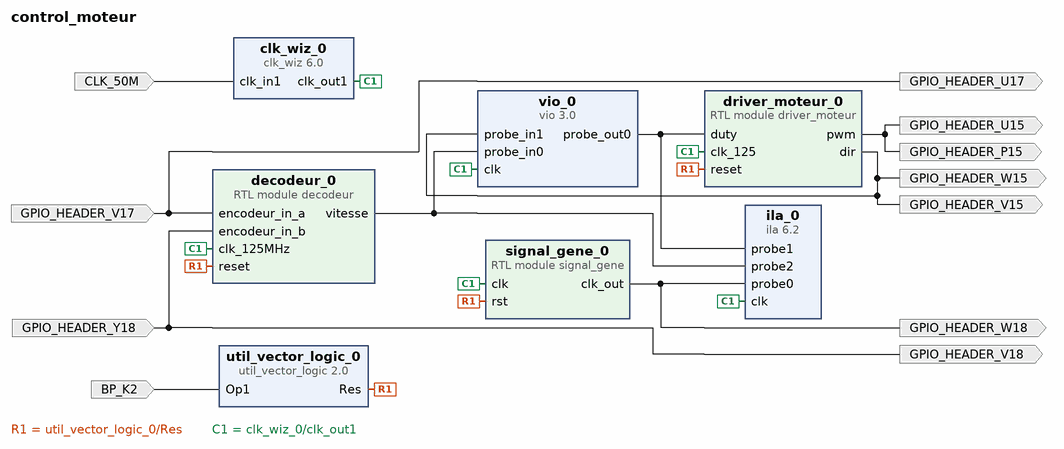
[diagram p0: block diagram of the top level]
# Vivado block design control_moteur, xc7z010clg400-1, Vivado 2020.2
create_bd_design control_moteur

create_bd_port -dir I GPIO_HEADER_V17
create_bd_port -dir I GPIO_HEADER_Y18
create_bd_port -dir I -type rst BP_K2
create_bd_port -dir I -type clk CLK_50M
set_property -dict {CONFIG.FREQ_HZ 50000000} [get_bd_ports CLK_50M]
create_bd_port -dir O GPIO_HEADER_U15
create_bd_port -dir O GPIO_HEADER_V15
create_bd_port -dir O GPIO_HEADER_W15
create_bd_port -dir O GPIO_HEADER_P15
create_bd_port -dir O GPIO_HEADER_V18
create_bd_port -dir O GPIO_HEADER_U17
create_bd_port -dir O GPIO_HEADER_W18

create_bd_cell -type ip -vlnv xilinx.com:ip:clk_wiz:6.0 clk_wiz_0
set_property -dict [list \
  CONFIG.CLKIN1_JITTER_PS 200.0 \
  CONFIG.CLKOUT1_DRIVES BUFG \
  CONFIG.CLKOUT1_JITTER 154.207 \
  CONFIG.CLKOUT1_PHASE_ERROR 164.985 \
  CONFIG.CLKOUT1_REQUESTED_OUT_FREQ 125 \
  CONFIG.CLKOUT2_DRIVES BUFG \
  CONFIG.CLKOUT3_DRIVES BUFG \
  CONFIG.CLKOUT4_DRIVES BUFG \
  CONFIG.CLKOUT5_DRIVES BUFG \
  CONFIG.CLKOUT6_DRIVES BUFG \
  CONFIG.CLKOUT7_DRIVES BUFG \
  CONFIG.MMCM_CLKFBOUT_MULT_F 20.000 \
  CONFIG.MMCM_CLKIN1_PERIOD 20.000 \
  CONFIG.MMCM_CLKIN2_PERIOD 10.0 \
  CONFIG.MMCM_CLKOUT0_DIVIDE_F 8.000 \
  CONFIG.PRIM_IN_FREQ 50.0 \
  CONFIG.SECONDARY_SOURCE Single_ended_clock_capable_pin \
  CONFIG.USE_LOCKED false \
  CONFIG.USE_PHASE_ALIGNMENT false \
  CONFIG.USE_RESET false \
] [get_bd_cells clk_wiz_0]
create_bd_cell -type ip -vlnv xilinx.com:ip:vio:3.0 vio_0
set_property -dict {CONFIG.C_NUM_PROBE_IN 2 CONFIG.C_PROBE_OUT0_WIDTH 16} [get_bd_cells vio_0]
create_bd_cell -type ip -vlnv xilinx.com:ip:util_vector_logic:2.0 util_vector_logic_0
set_property -dict {CONFIG.C_OPERATION not CONFIG.C_SIZE 0} [get_bd_cells util_vector_logic_0]
create_bd_cell -type module -reference driver_moteur driver_moteur_0
create_bd_cell -type module -reference decodeur decodeur_0
create_bd_cell -type ip -vlnv xilinx.com:ip:ila:6.2 ila_0
set_property -dict [list \
  CONFIG.ALL_PROBE_SAME_MU true \
  CONFIG.ALL_PROBE_SAME_MU_CNT 2 \
  CONFIG.C_ADV_TRIGGER true \
  CONFIG.C_DATA_DEPTH 8192 \
  CONFIG.C_ENABLE_ILA_AXI_MON false \
  CONFIG.C_EN_STRG_QUAL 1 \
  CONFIG.C_MONITOR_TYPE Native \
  CONFIG.C_NUM_OF_PROBES 3 \
  CONFIG.C_PROBE0_MU_CNT 2 \
  CONFIG.C_PROBE0_TYPE 0 \
  CONFIG.C_PROBE10_MU_CNT 2 \
  CONFIG.C_PROBE11_MU_CNT 2 \
  CONFIG.C_PROBE12_MU_CNT 2 \
  CONFIG.C_PROBE13_MU_CNT 2 \
  CONFIG.C_PROBE14_MU_CNT 2 \
  CONFIG.C_PROBE15_MU_CNT 2 \
  CONFIG.C_PROBE16_MU_CNT 2 \
  CONFIG.C_PROBE17_MU_CNT 2 \
  CONFIG.C_PROBE18_MU_CNT 2 \
  CONFIG.C_PROBE19_MU_CNT 2 \
  CONFIG.C_PROBE1_MU_CNT 2 \
  CONFIG.C_PROBE1_WIDTH 16 \
  CONFIG.C_PROBE20_MU_CNT 2 \
  CONFIG.C_PROBE21_MU_CNT 2 \
  CONFIG.C_PROBE22_MU_CNT 2 \
  CONFIG.C_PROBE23_MU_CNT 2 \
  CONFIG.C_PROBE24_MU_CNT 2 \
  CONFIG.C_PROBE25_MU_CNT 2 \
  CONFIG.C_PROBE26_MU_CNT 2 \
  CONFIG.C_PROBE27_MU_CNT 2 \
  CONFIG.C_PROBE28_MU_CNT 2 \
  CONFIG.C_PROBE29_MU_CNT 2 \
  CONFIG.C_PROBE2_MU_CNT 2 \
  CONFIG.C_PROBE2_TYPE 0 \
  CONFIG.C_PROBE2_WIDTH 16 \
  CONFIG.C_PROBE30_MU_CNT 2 \
  CONFIG.C_PROBE31_MU_CNT 2 \
  CONFIG.C_PROBE32_MU_CNT 2 \
  CONFIG.C_PROBE33_MU_CNT 2 \
  CONFIG.C_PROBE34_MU_CNT 2 \
  CONFIG.C_PROBE35_MU_CNT 2 \
  CONFIG.C_PROBE36_MU_CNT 2 \
  CONFIG.C_PROBE37_MU_CNT 2 \
  CONFIG.C_PROBE38_MU_CNT 2 \
  CONFIG.C_PROBE39_MU_CNT 2 \
  CONFIG.C_PROBE3_MU_CNT 2 \
  CONFIG.C_PROBE40_MU_CNT 2 \
  CONFIG.C_PROBE41_MU_CNT 2 \
  CONFIG.C_PROBE42_MU_CNT 2 \
  CONFIG.C_PROBE43_MU_CNT 2 \
  CONFIG.C_PROBE4_MU_CNT 2 \
  CONFIG.C_PROBE5_MU_CNT 2 \
  CONFIG.C_PROBE6_MU_CNT 2 \
  CONFIG.C_PROBE7_MU_CNT 2 \
  CONFIG.C_PROBE8_MU_CNT 2 \
  CONFIG.C_PROBE9_MU_CNT 2 \
  CONFIG.C_TRIGIN_EN false \
] [get_bd_cells ila_0]
create_bd_cell -type module -reference signal_gene signal_gene_0
set_property -dict {CONFIG.division_horloge 25000 CONFIG.nb_pulse_etat_haut 12500} [get_bd_cells signal_gene_0]

# ---- connections ----

connect_bd_net -net encodeur_in_a_0_1 [get_bd_ports GPIO_HEADER_V17] [get_bd_ports GPIO_HEADER_U17] [get_bd_pins decodeur_0/encodeur_in_a]
connect_bd_net -net encodeur_in_b_0_1 [get_bd_ports GPIO_HEADER_Y18] [get_bd_ports GPIO_HEADER_V18] [get_bd_pins decodeur_0/encodeur_in_b]
connect_bd_net -net reset_0_1 [get_bd_pins util_vector_logic_0/Res] \
  [get_bd_pins driver_moteur_0/reset] [get_bd_pins decodeur_0/reset] [get_bd_pins signal_gene_0/rst]
connect_bd_net -net clk_in1_0_1 [get_bd_ports CLK_50M] [get_bd_pins clk_wiz_0/clk_in1]
connect_bd_net [get_bd_pins driver_moteur_0/pwm] [get_bd_ports GPIO_HEADER_U15] [get_bd_ports GPIO_HEADER_P15]
connect_bd_net [get_bd_pins driver_moteur_0/dir] [get_bd_ports GPIO_HEADER_V15] [get_bd_pins vio_0/probe_in1] [get_bd_ports GPIO_HEADER_W15]
connect_bd_net [get_bd_pins clk_wiz_0/clk_out1] \
  [get_bd_pins vio_0/clk] [get_bd_pins driver_moteur_0/clk_125] [get_bd_pins decodeur_0/clk_125MHz] [get_bd_pins ila_0/clk] \
  [get_bd_pins signal_gene_0/clk]
connect_bd_net [get_bd_pins vio_0/probe_out0] [get_bd_pins driver_moteur_0/duty] [get_bd_pins ila_0/probe1]
connect_bd_net [get_bd_pins decodeur_0/vitesse] [get_bd_pins vio_0/probe_in0] [get_bd_pins ila_0/probe2]
connect_bd_net -net BP_K2_1 [get_bd_ports BP_K2] [get_bd_pins util_vector_logic_0/Op1]
connect_bd_net [get_bd_pins signal_gene_0/clk_out] [get_bd_pins ila_0/probe0] [get_bd_ports GPIO_HEADER_W18]

validate_bd_design
save_bd_design
